# EasyEDA Pro project ProPrj_国赛底层板子_2026-05-31.epro, board PCB1
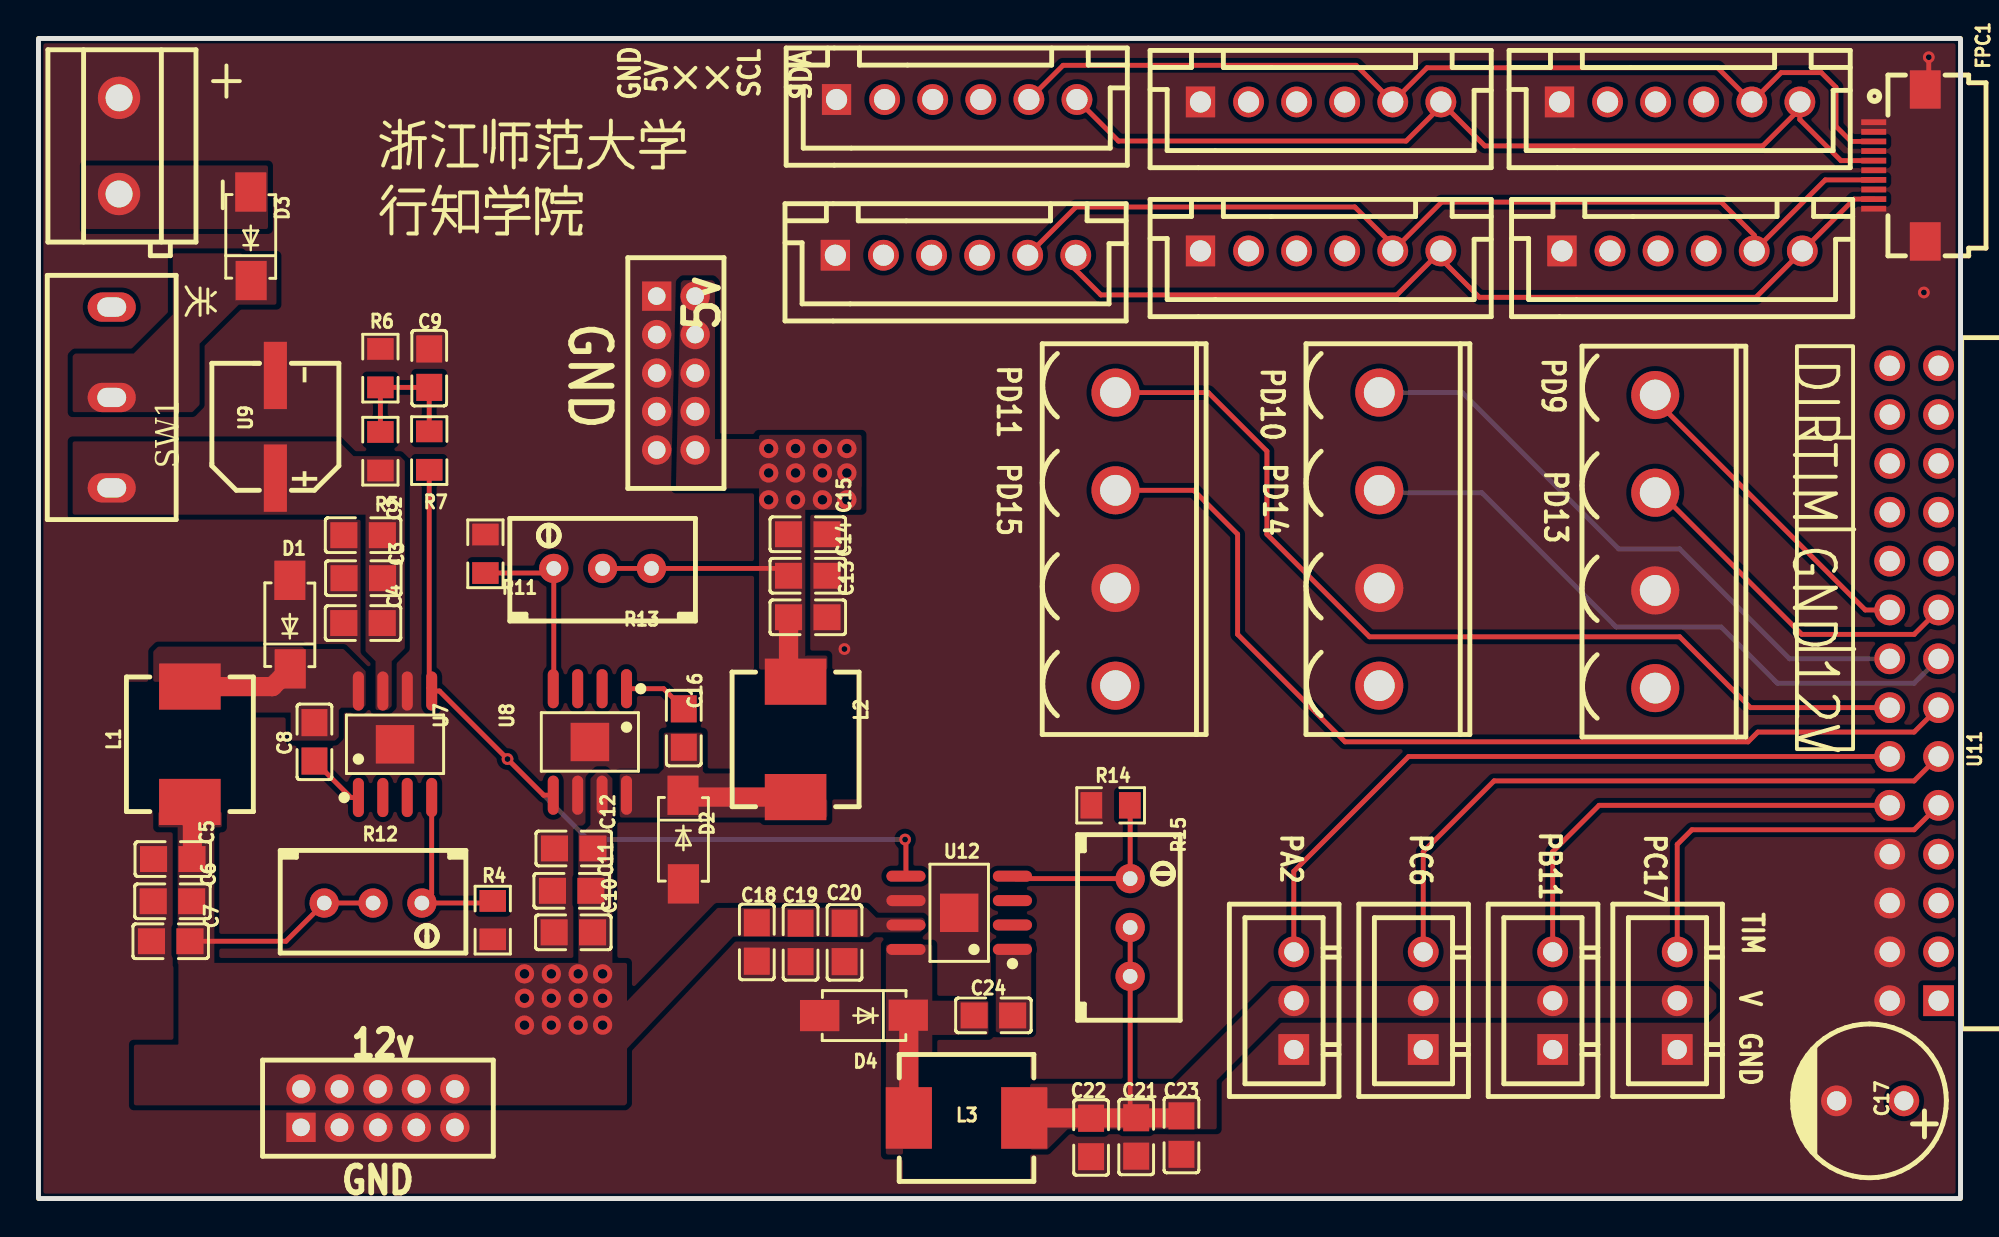
[diagram p5: board, top side]
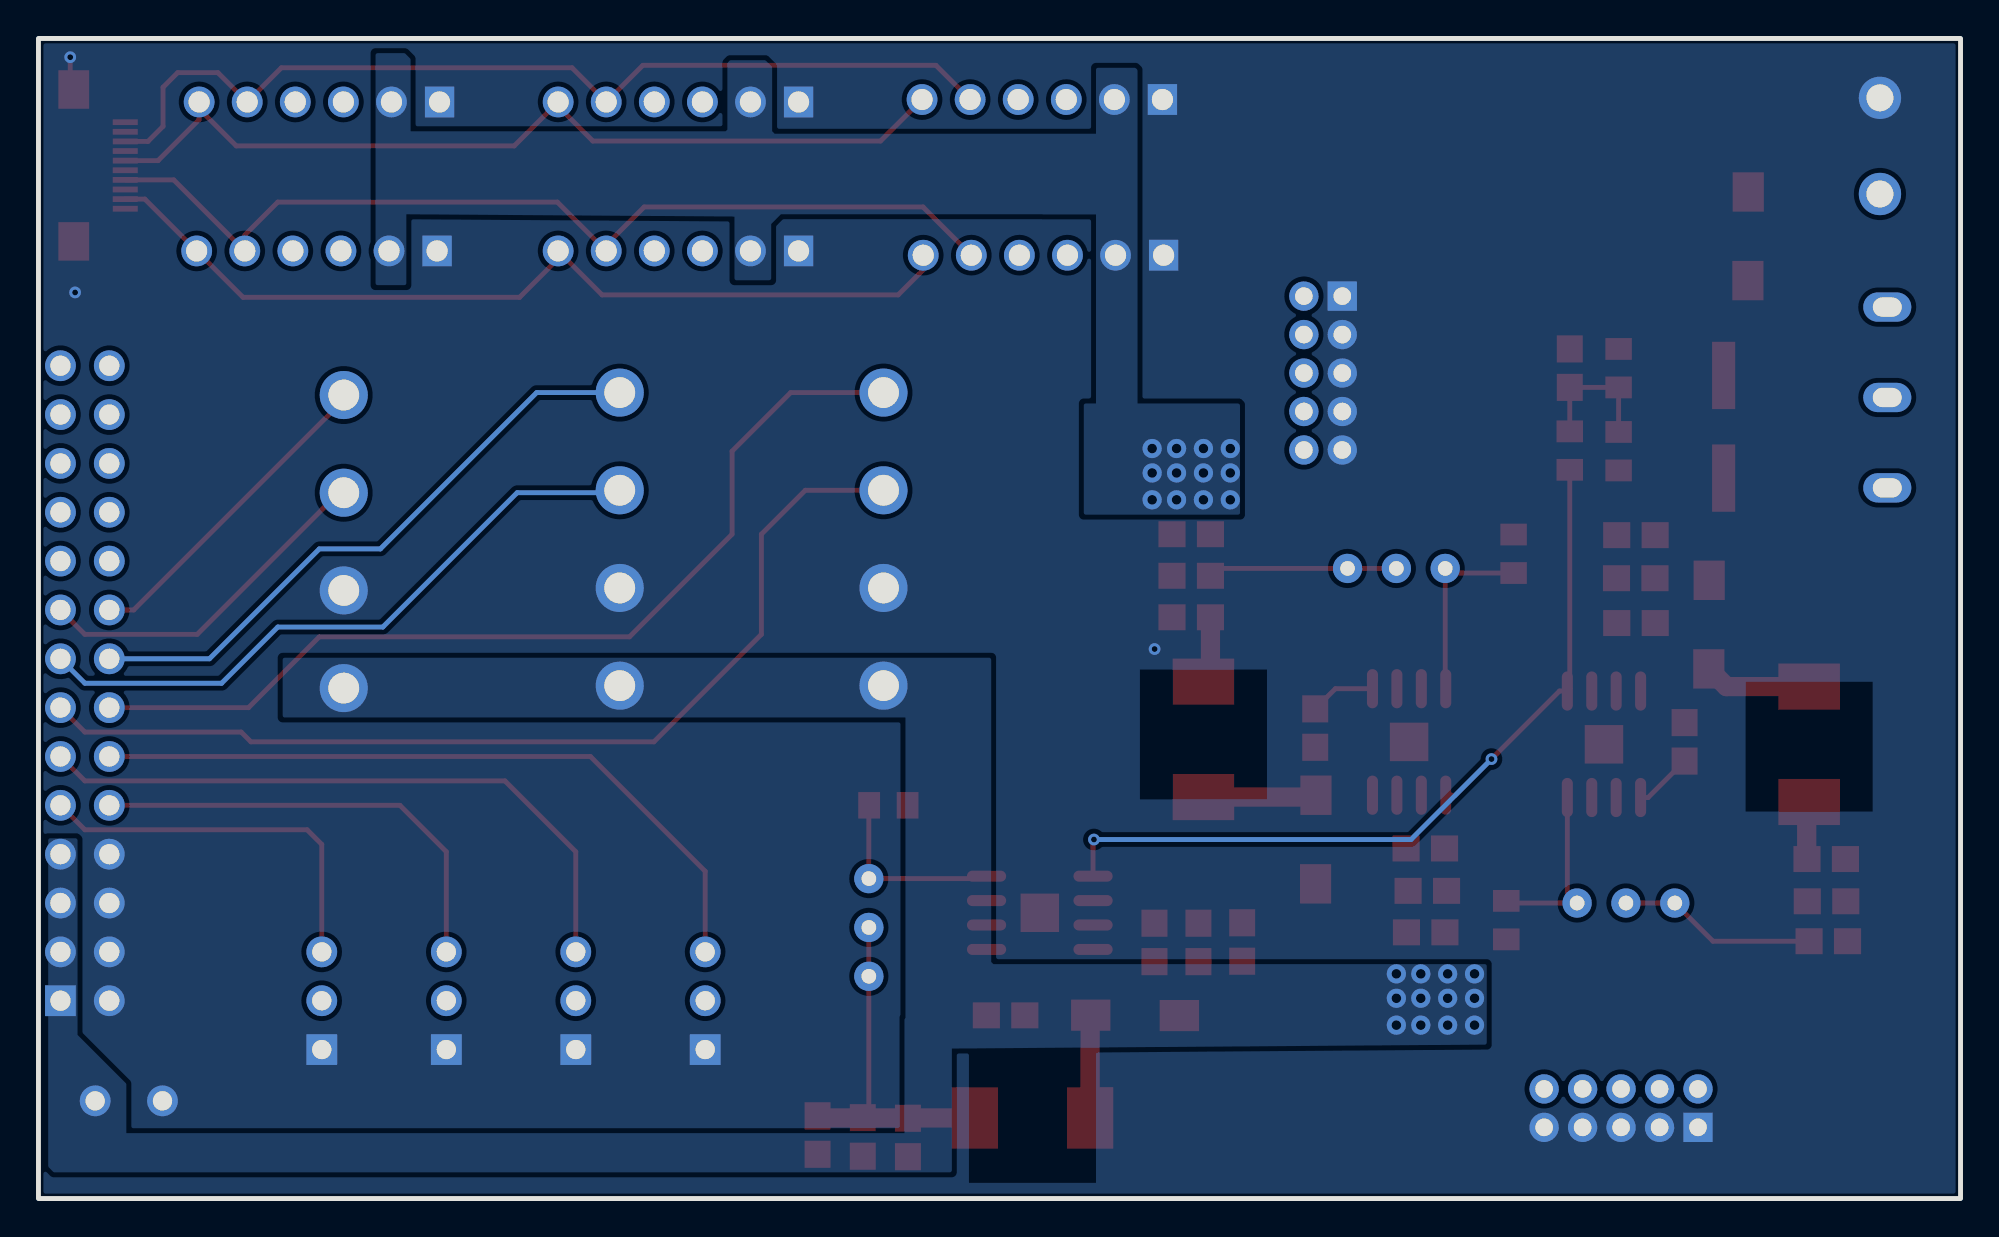
[diagram p6: board, bottom side, seen from below]

Outline 99.95 x 60.33 mm; copper layers: Top Layer, Bottom Layer. Coordinates in mm from the lower left corner of the outline.
Outline path: rectangle 0,60.33 99.95,0
Stack: Top Layer 0.035mm / Dielectric1 1.51mm FR4 er 4.5 / Bottom Layer 0.035mm

## Design rules (mm)
template: 自定义配置
spacing copperThickness1oz (default): track to track 0.102, other pairs 0.152 to 0.3
spacing copperThickness2oz: track to track 0.203, other pairs 0.152 to 0.3
track width copperThickness1oz (default): min 0.127, default 0.254, max 2.54
track width copperThickness2oz: min 0.203, default 0.254, max 2.54
differential pair differentialPair (default): width min 0.127, default 0.254, max 2.54; gap min 0.152, default 0.152
via viaSize (default): diameter min 0.5, default 0.61, max 10; hole min 0.3, default 0.305, max 6.3

## Placement (name value [footprint] x y rotation side)
5v  PHD-2X5A  [CONN-TH_10P-P2.00_PHD2.0MM-2X5]  33.15 42.93 270 top
C2  22uF  [C0805]  16.88 34.5 0 top
C3  22uF  [C0805]  16.89 32.26 0 top
C4  4.7uF  [C0805]  16.88 29.92 0 top
C5  22uF  [C0805]  6.98 17.65 180 top
C6  22uF  [C0805]  6.97 15.46 180 top
C7  100nF  [C0805]  6.88 13.38 180 top
C8  10uF  [C0805]  14.35 23.75 270 top
C9  100nF  [C0805]  20.32 43.18 90 top
C10  22uF  [C0805]  27.81 13.84 0 top
C11  22uF  [C0805]  27.73 16 0 top
C12  4.7uF  [C0805]  27.83 18.2 0 top
C13  22uF  [C0805]  40 30.23 0 top
C14  22uF  [C0805]  40 32.39 0 top
C15  100nF  [C0805]  40 34.54 0 top
C16  10uF  [C0805]  33.56 24.46 90 top
C17  470uF  [CAP-TH_BD8.0-P3.50-D0.5-FD]  95.25 5.08 180 top
C18  22uF  [C0805]  37.35 13.34 90 top
C19  22uF  [C0805]  39.63 13.32 90 top
C20  4.7uF  [C0805]  41.92 13.32 90 top
C21  22uF  [C0805]  57.08 3.2 270 top
C22  22uF  [C0805]  54.74 3.18 270 top
C23  100nF  [C0805]  59.44 3.3 270 top
C24  10uF  [C0805]  49.66 9.53 0 top
CN3  WJ2EDGV-5.08-4P  [CONN-TH_4P-P5.08_WJ2EDGV-5.08-4P]  56.01 34.29 90 top
CN5  WJ2EDGV-5.08-4P  [CONN-TH_4P-P5.08_WJ2EDGV-5.08-4P]  69.72 34.29 90 top
CN6  WJ2EDGV-5.08-4P  [CONN-TH_4P-P5.08_WJ2EDGV-5.08-4P]  84.07 34.16 90 top
CN9  ZX-XH2.54-3PZZ  [CONN-TH_3P-P2.54_2501S-3P]  72.01 10.29 90 top
CN10  ZX-XH2.54-3PZZ  [CONN-TH_3P-P2.54_2501S-3P]  85.22 10.29 90 top
CN11  ZX-XH2.54-3PZZ  [CONN-TH_3P-P2.54_2501S-3P]  65.28 10.29 90 top
CN12  ZX-XH2.54-3PZZ  [CONN-TH_3P-P2.54_2501S-3P]  78.74 10.29 90 top
D1  SS54_C7420369  [SMA_L4.3-W2.6-LS5.0-FD]  13.08 29.84 270 top
D2  SS54_C7420369  [SMA_L4.3-W2.6-LS5.0-FD]  33.53 18.67 90 top
D3  SS54_C7420369  [SMA_L4.3-W2.6-LS5.0-FD]  11.05 50.04 270 top
D4  SS54_C7420369  [SMA_L4.3-W2.6-LS5.0-FD]  42.93 9.53 0 top
FPC1  AFC01-S10FCA-00  [FPC-SMD_P0.5-10P_FGS-XJ-H2.0]  96.77 53.72 270 top
L1  6.8uH  [IND-SMD_L7.0-W6.6]  7.87 23.62 90 top
L2  6.8uH  [IND-SMD_L7.0-W6.6]  39.37 23.88 270 top
L3  6.8uH  [IND-SMD_L7.0-W6.6]  48.26 4.19 180 top
P1  PHD-2X5A  [CONN-TH_10P-P2.00_PHD2.0MM-2X5]  17.65 4.7 0 top
R4  2k  [R0805]  23.62 14.48 90 top
R5  10k  [R0805]  17.78 38.86 90 top
R6  6.8kNTC  [R0805]  17.78 43.18 90 top
R7  0  [R0805]  20.32 38.89 90 top
R11  3.3k  [R0805]  23.24 33.53 270 top
R12  50kΩ  [RES-ADJ-TH_3296W]  17.4 15.37 270 top
R13  50kΩ  [RES-ADJ-TH_3296W]  29.34 32.77 90 top
R14  3.3k  [R0805]  55.75 20.45 0 top
R15  50kΩ  [RES-ADJ-TH_3296W]  56.77 14.1 0 top
SW1  KH-SS12D10-G9-3.5  [SW-TH_KH-SS12D10-G9-3.5]  3.81 41.66 90 top
U1  ZX-XH2.54-6PZZ  [CONN-TH_6P-P2.50_ZX-XH2.54-6PZZ]  47.69 49.05 180 top
U2  ZX-XH2.54-6PZZ  [CONN-TH_6P-P2.50_ZX-XH2.54-6PZZ]  66.68 57.02 180 top
U3  ZX-XH2.54-6PZZ  [CONN-TH_6P-P2.50_ZX-XH2.54-6PZZ]  85.34 57.02 180 top
U4  ZX-XH2.54-6PZZ  [CONN-TH_6P-P2.50_ZX-XH2.54-6PZZ]  85.47 49.28 180 top
U5  ZX-XH2.54-6PZZ  [CONN-TH_6P-P2.50_ZX-XH2.54-6PZZ]  47.75 57.15 180 top
U6  ZX-XH2.54-6PZZ  [CONN-TH_6P-P2.50_ZX-XH2.54-6PZZ]  66.68 49.28 180 top
U7  RT8289GSP  [SOIC-8_L5.0-W4.0-P1.27-LS6.0-BL-EP2.0]  18.54 23.62 0 top
U8  RT8289GSP  [SOIC-8_L5.0-W4.0-P1.27-LS6.0-BL-EP2.0]  28.67 23.74 180 top
U9  220uF  [CAP-SMD_BD6.3-L6.5-W6.5-LS7.2-FD]  12.32 40.13 90 top
U10  电源  [CONN-TH_P5.00_KF301-5.0-2P]  4.19 54.74 270 top
U11  PZ254-2-14-W-2.5-G1  [HDR-TH_28P-P2.54-H-M-R2-C14-S2.54]  97.54 26.8 90 top
U12  RT8289GSP  [SOIC-8_L5.0-W4.0-P1.27-LS6.0-BL-EP2.0]  47.88 14.86 90 top

## Footprints (pads in the part's own frame, mm; a bottom-side part is the same pattern mirrored in y, then rotated)
C0805
  rect 1.41x1.35 smd: 1(-1,0) 2(1,0)
CAP-SMD_BD6.3-L6.5-W6.5-LS7.2-FD
  rect 3.5x1.2 smd: 1(-2.67,0) 2(2.67,0)
CAP-TH_BD8.0-P3.50-D0.5-FD
  round 1.6 hole 1: 1(-1.75,0) 2(1.75,0)
CONN-TH_3P-P2.54_2501S-3P
  rect 1.6x1.6 hole 1: 1(-2.54,0)
  round 1.6 hole 1: 2(0,0) 3(2.54,0)
CONN-TH_4P-P5.08_WJ2EDGV-5.08-4P
  round 2.5 hole 1.6: 1(-7.62,0) 2(-2.54,0) 3(2.54,0) 4(7.62,0)
CONN-TH_6P-P2.50_ZX-XH2.54-6PZZ
  rect 1.524x1.6 hole 1.1: 1(6.25,0)
  round 1.6 hole 1.1: 2(3.75,0) 3(1.25,0) 4(-1.25,0) 5(-3.75,0) 6(-6.25,0)
CONN-TH_10P-P2.00_PHD2.0MM-2X5
  rect 1.524x1.524 hole 0.914: 1(-4,-0.998)
  round 1.524 hole 0.914: 2(-4,1.001) 3(-2.002,-0.998) 4(-2.002,1.001) 5(0,-0.998) 6(0,1.001) 7(1.999,-0.998) 8(1.999,1.001) 9(4,-0.998) 10(4,1.001)
CONN-TH_P5.00_KF301-5.0-2P
  round 2.2 hole 1.4: 1(-2.5,0) 2(2.5,0)
FPC-SMD_P0.5-10P_FGS-XJ-H2.0
  rect 0.3x1.3 smd: 1(-2.25,-1.339) 2(-1.75,-1.339) 3(-1.25,-1.34) 4(-0.75,-1.339) 5(-0.25,-1.34) 6(0.25,-1.339) 7(0.75,-1.339) 8(1.25,-1.339) 9(1.75,-1.339) 10(2.25,-1.34)
  rect 2x1.6 smd: 11(3.95,1.34) 12(-3.95,1.34)
HDR-TH_28P-P2.54-H-M-R2-C14-S2.54
  rect 1.6x1.6 hole 1.05: 1(-16.51,-1.27)
  round 1.6 hole 1.05: 2(-16.51,1.27) 3(-13.97,-1.27) 4(-13.97,1.27) 5(-11.43,-1.27) 6(-11.43,1.27) 7(-8.89,-1.27) 8(-8.89,1.27) 9(-6.35,-1.27) 10(-6.35,1.27) 11(-3.81,-1.27) 12(-3.81,1.27) 13(-1.27,-1.27) 14(-1.27,1.27) 15(1.27,-1.27) 16(1.27,1.27) 17(3.81,-1.27) 18(3.81,1.27) 19(6.35,-1.27) 20(6.35,1.27) 21(8.89,-1.27) 22(8.89,1.27) 23(11.43,-1.27) 24(11.43,1.27) 25(13.97,-1.27) 26(13.97,1.27) 27(16.51,-1.27) 28(16.51,1.27)
IND-SMD_L7.0-W6.6
  rect 2.4x3.2 smd: 1(-3,0) 2(3,0)
R0805
  rect 1.133x1.377 smd: 1(-1,0) 2(1,0)
RES-ADJ-TH_3296W
  round 1.524 hole 0.762: 1(0,2.54) 2(0,0) 3(0,-2.54)
SMA_L4.3-W2.6-LS5.0-FD
  rect 2.046x1.62 smd: 1(-2.304,-0.009) 2(2.304,0.009)
SOIC-8_L5.0-W4.0-P1.27-LS6.0-BL-EP2.0
  oval 0.574x2.038 smd: 1(-1.905,-2.769) 2(-0.635,-2.769) 3(0.635,-2.769) 4(1.905,-2.769) 5(1.905,2.769) 6(0.635,2.769) 7(-0.635,2.769) 8(-1.905,2.769)
  rect 2x2 smd: 9(0,0)
SW-TH_KH-SS12D10-G9-3.5
  oval 1.524x2.5 hole 1x1.5: 1(-4.7,0) 2(0,0) 3(4.7,0)

## Nets
As in the schematic, except:
5V: 5v.2 5v.4 5v.6 5v.8 5v.10 C13.1 C14.1 C15.1 L2.1 R13.2 R13.3 U1.2 U2.2 U3.2 U4.2 U5.2 U6.2
GND: 5v.1 5v.3 5v.5 5v.7 5v.9 C2.1 C3.1 C4.1 C5.2 C6.2 C7.2 C9.2 C10.1 C11.1 C12.1 C13.2 C14.2 C15.2 C17.2 C18.1 C19.1 C20.1 C21.2 C22.2 C23.2 CN3.2 CN5.2 CN6.2 CN9.1 CN10.1 CN11.1 CN12.1 D1.1 D2.1 D4.1 FPC1.1 FPC1.2 FPC1.4 FPC1.6 FPC1.8 FPC1.10 FPC1.11 FPC1.12 P1.1 P1.3 P1.5 P1.7 P1.9 R4.1 R6.2 R11.1 R14.1 U1.1 U2.1 U3.1 U4.1 U5.1 U6.1 U7.6 U7.9 U8.6 U8.9 U9.2 U10.1 U11.2 U11.4 U11.6 U11.8 U12.6 U12.9
PF0_I2C2_SDA: FPC1.5 U2.6 U3.6 U5.6
PF1_I2C2_SCL: FPC1.3 U2.5 U3.5 U5.5
PF14_I2C4_SCL: FPC1.7 U1.5 U4.5 U6.5
PF15_I2C4_SDA: FPC1.9 U1.6 U4.6 U6.6

Pads without a net: SW1 3; U1 3 4; U2 3 4; U3 3 4; U4 3 4; U5 3 4; U6 3 4; U7 2 3; U8 2 3; U12 2 3

## Via types
v1: diameter 0.61, hole 0.305, Top Layer to Bottom Layer, 5 vias
v2: diameter 1, hole 0.5, Top Layer to Bottom Layer, 24 vias

## Routing (per net, layer and track width the routed paths; a pad name or vN(x,y) marks a point on that pad's centre or on a via; arc(x,y) is an arc through that point)
5V: length 13.3
  Top Layer w0.254: C14.1 38.62,32.77 R13.3 R13.2
  Top Layer w1: L2.1 39,27.24 C13.1
  vias: v2(37.97,39) v2(37.97,37.73) v2(37.97,36.33) v2(39.37,39) v2(39.37,37.73) v2(39.37,36.33) v2(40.77,39) v2(40.77,37.73) v2(40.77,36.33) v2(42.04,39) v2(42.04,37.73) v2(42.04,36.33)
12V: length 13.4
  Top Layer w0.254: R12.2 R12.3 12.87,13.38 C7.1
  Top Layer w1: C5.1 8,17.67 8,20.5 L1.1
  vias: v2(25.27,11.68) v2(25.27,10.41) v2(25.27,9.02) v2(26.67,11.68) v2(26.67,10.41) v2(26.67,9.02) v2(28.07,11.68) v2(28.07,10.41) v2(28.07,9.02) v2(29.34,11.68) v2(29.34,10.41) v2(29.34,9.02)
GND: length 1.7
  Top Layer w0.254: 98.24,57.67 98.3,57.73 v1(98.3,59.35)
  vias: v1(41.91,28.58) v1(98.04,47.12)
FB1: length 9.4
  Top Layer w0.254: R4.2 23.51,15.37 R12.1 20.45,15.88 U7.4
FB2: length 9.9
  Top Layer w0.254: U8.4 26.8,26.54 R13.1 26.56,32.53 R11.2
FB3: length 10
  Top Layer w0.254: U12.4 50.78,16.64 R15.1 56.77,20.43 R14.2
P_EN: length 7.1
  Top Layer w0.254: R7.2 C9.1 R6.1 R5.2
P_EN1: length 44.4
  Top Layer w0.254: U12.5 45.11,18.54 45.02,18.63 ; R7.1 20.32,26.52 U7.5 20.85,26.39 v1(24.39,22.85) 26.27,20.97 U8.5
  Bottom Layer w0.254: v1(24.39,22.85) 28.58,18.67 v1(45.06,18.67)
PA2_TIM2_CH3: length 37.7
  Top Layer w0.254: U11.12 71.25,22.99 65.28,17.02 CN11.3
PB11_TIM2_CH4: length 23.7
  Top Layer w0.254: U11.10 81.15,20.45 78.74,18.03 CN12.3
PC6_TIM3_CH1: length 34.1
  Top Layer w0.254: U11.11 97.54,21.72 75.69,21.72 72.01,18.03 CN9.3
PC7_TIM3_CH2: length 20
  Top Layer w0.254: CN10.3 85.22,18.41 85.98,19.18 97.54,19.18 U11.9
PD9_DIR_CONV: length 16.7
  Top Layer w0.254: U11.18 95,30.61 84.46,41.15 84.46,41.66
PD10_DIR_CONV: length 32.3
  Bottom Layer w0.254: U11.16 91.06,28.07 85.34,33.78 82.17,33.78 74.04,41.91 CN5.4
PD11_DIR_CONV: length 49.6
  Top Layer w0.254: CN3.4 60.83,41.91 63.88,38.86 63.88,34.54 69.22,29.21 85.34,29.21 89.03,25.53 U11.14
PD13_TIM4_CH2_CONV: length 17.9
  Top Layer w0.254: U11.17 97.54,29.34 91.69,29.34 84.46,36.58
PD14_TIM4_CH3_CONV: length 33.8
  Bottom Layer w0.254: U11.15 97.54,26.8 90.42,26.8 87.5,29.72 82.04,29.72 75.06,36.7 69.85,36.7 CN5.3
PD15_TIM4_CH4_CONV: length 52
  Top Layer w0.254: U11.13 97.54,24.26 89.41,24.26 88.9,23.75 67.94,23.75 62.36,29.34 62.36,34.54 60.07,36.83 CN3.3
PF0_I2C2_SDA: length 46.8
  Top Layer w0.254: U5.6 56.16,54.99 71.12,54.99 72.93,56.8 U2.6 75.21,54.74 89.66,54.74 91.59,56.67 ; 91.59,56.67 U3.6 ; 91.59,56.67 91.59,56.11 93.73,53.97 FPC1.5
PF1_I2C2_SCL: length 50.2
  Top Layer w0.254: FPC1.3 94.25,54.97 93.47,55.75 93.47,57.78 92.71,58.55 90.62,58.55 U3.5 87.32,58.8 72.2,58.8 U2.5 68.52,58.93 53.28,58.93 U5.5
PF14_I2C4_SCL: length 50.3
  Top Layer w0.254: FPC1.7 92.92,52.97 U4.5 89.22,50.1 87.5,51.82 72.97,51.82 U6.5 70.43,49.59 68.45,51.56 53.95,51.56 U1.5
PF15_I2C4_SDA: length 47.1
  Top Layer w0.254: FPC1.9 94.42,51.97 U4.6 89.31,46.86 74.93,46.86 72.93,48.87 U6.6 70.64,46.99 55.25,46.99 53.94,48.29 U1.6
V: length 18.2
  Top Layer w0.254: R15.2 56.77,4.52 C21.1
  Top Layer w1: C23.1 59.32,4.19 L3.1
$1N1402: length 5.6
  Top Layer w1: L1.2 12.17,26.62 D1.2
$1N1403: length 3.1
  Top Layer w0.254: U7.1 16.25,20.85 C8.2
$1N1889: length 5.8
  Top Layer w1: 33.65,20.97 33.74,20.88 L2.2
$1N1890: length 3.4
  Top Layer w0.254: C16.2 32.51,26.51 U8.1
$1N8259: length 5.4
  Top Layer w1: L3.2 45.26,9.5 D4.2

## Copper pours and planes (outline as drawn; the poured copper is in the pictures)
5V on Top Layer: 37.47,39.72 37.47,25.65 41.02,25.65 41.02,28.24 39.92,28.24 39.88,28.19 39.88,35.81 42.8,35.81 42.8,39.72
5V on Top Layer: 33.4,47.62 33.15,36.93 42.8,36.93 42.8,39.5 35.18,39.5 35.18,47.62 35.05,47.75 33.53,47.75
5V on Bottom Layer: 42.8,38.73 42.8,58.69 42.91,58.8 44.96,58.8 44.96,55.37 61.67,55.37 61.8,55.5 61.8,58.84 62.15,59.19 63.99,59.19 64.12,59.05 64.12,55.59 64.21,55.5 80.6,55.5 80.6,59.26 80.9,59.56 82.42,59.56 82.42,47.5 80.82,47.5 80.82,51.18 63.9,51.07 63.75,51.05 63.75,47.75 61.85,47.75 61.85,50.67 61.34,51.18 47.75,51.18 47.75,51.18 44.96,51.18 44.96,38.99 43.05,38.99
5V on Bottom Layer: 37.47,35.56 45.59,35.56 45.59,41.34 37.53,41.34 37.47,41.28
12V on Top Layer: 24.64,9.4 24.64,7.62 30.44,7.62 36.13,13.62 43.18,13.59 43.43,13.84 45.85,13.84 46.1,14.1 46.1,14.48 45.97,14.61 43.56,14.61 43.04,15.13 35.31,15.12 29.77,9.4
12V on Top Layer: 7.28,14.28 7.28,8.04 7.24,8 4.96,8 4.96,4.85 30.5,4.85 30.61,4.95 30.61,12.26 9.11,12.26 9.11,14.08 8.8,14.39 7.39,14.39
12V on Top Layer: 28.07,9.94 28.07,19.14 28.41,19.14 28.7,19.43 28.7,21.84 29.08,22.22 29.47,22.22 29.84,21.84 29.84,9.94
12V on Top Layer: 6.22,22.1 6.22,19.3 7.24,19.3 7.24,12.16 9.11,12.16 9.14,12.19 9.14,19.3 9.54,19.3 9.54,22.08 9.53,22.1
12V on Bottom Layer: 24.64,12.19 24.64,8 54.86,7.78 54.86,25.02 87.25,25.02 87.25,28.12 50.41,28.12 50.41,12.31 50.29,12.19
12V on Bottom Layer: 52.45,9.4 52.45,1.36 99.15,1.36 99.44,1.65 99.44,18.74 97.98,18.74 97.92,18.67 97.92,8.51 95.38,5.97 95.38,3.4 54.92,3.4 54.92,9.4
GND on Top Layer: 0,60.33 99.95,60.33 99.95,0 0,0
GND on Bottom Layer: 0,60.33 99.95,60.33 99.95,0 0,0
DC1 on Top Layer: 1.78,39.37 1.78,35.56 17.01,35.56 17.01,28.46 17.53,27.94 17.53,25.4 18.16,25.4 18.37,25.61 18.37,27.94 19.05,28.62 19.05,38.35 18.8,38.61 16.38,38.61 15.62,39.37
IN+ on Top Layer: 10.67,49.02 12.37,49.02 12.37,46.48 10.41,46.48 8.38,44.45 8.38,41.28 8,40.89 1.78,40.89 1.78,43.81 1.91,43.94 4.95,43.94 6.98,45.97 6.98,49.15 10.54,49.15
V on Top Layer: 49.91,5.84 49.91,2.54 52.45,2.54 53.51,3.6 61.27,3.6 61.27,6.15 64.52,9.4 86.74,9.4 87.25,9.91 87.25,10.67 86.87,11.05 64.13,11.05 59.06,5.97 50.04,5.97
$1N1402 on Top Layer: 5.97,28.45 5.97,25.27 13.11,25.27 13.11,23.81 15.43,23.81 15.62,24 15.62,25.4 15.75,25.53 16.89,25.53 17.02,25.65 17.02,27.42 15.86,28.58 13.84,28.58 13.72,28.7 6.22,28.7
$1N1889 on Top Layer: 30.23,22.1 30.23,19.81 40.89,19.81 41.02,19.69 41.02,22.1 34.67,22.1 34.54,22.22 34.54,24.22 32.51,24.22 32.51,22.35 32.26,22.1
$1N2276 on Top Layer: 2.41,53.72 11.94,53.72 11.94,50.42 2.41,50.42
$1N8259 on Top Layer: 44.07,13.21 46.48,13.21 46.48,2.29 44.07,2.29
$1N8259 on Top Layer: 44.07,10.29 49.4,10.29 49.4,8.51 44.07,8.51
$1N8260 on Top Layer: 49.78,13.26 51.62,13.26 51.62,8.64 49.78,8.64

## Text on the board
Top Silkscreen Layer: GND | 5V | SCL | SDA | PA2 | PC6 | PB11 | PC17 | V | TIM | PD11 | PD15 | PD10 | PD14 | PD9 | PD13 | 12v | + | - | DIR | 12V | 关 | 浙江师范大学 / 行知学院
